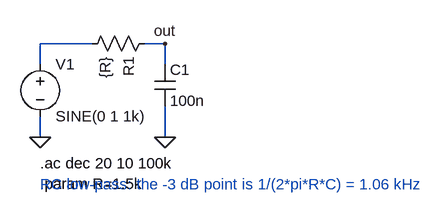
[diagram p0: schematic ltspice-rc.asc]
ltspice-rc.asc, the LTspice schematic file:
Version 4
SHEET 1 880 680
WIRE 144 96 64 96
WIRE 256 96 224 96
WIRE 256 128 256 96
WIRE 64 128 64 96
WIRE 64 240 64 208
WIRE 256 240 256 192
FLAG 64 240 0
FLAG 256 240 0
FLAG 256 96 out
SYMBOL voltage 64 112 R0
SYMATTR InstName V1
SYMATTR Value SINE(0 1 1k)
SYMATTR Value2 AC 1
SYMBOL res 240 80 R90
SYMATTR InstName R1
SYMATTR Value {R}
SYMBOL cap 240 128 R0
SYMATTR InstName C1
SYMATTR Value 100n
SYMATTR SpiceLine Rser=10m
TEXT 64 280 Left 2 !.ac dec 20 10 100k\n.param R=1.5k
TEXT 64 312 Left 2 ;RC low-pass: the -3 dB point is 1/(2*pi*R*C) = 1.06 kHz

The netlist it stands for:
* ltspice-rc.asc
V1 N001 0 SINE(0 1 1k) AC 1
R1 out N001 {R}
C1 out 0 100n Rser=10m
.ac dec 20 10 100k
.param R=1.5k
* RC low-pass: the -3 dB point is 1/(2*pi*R*C) = 1.06 kHz
.backanno
.end